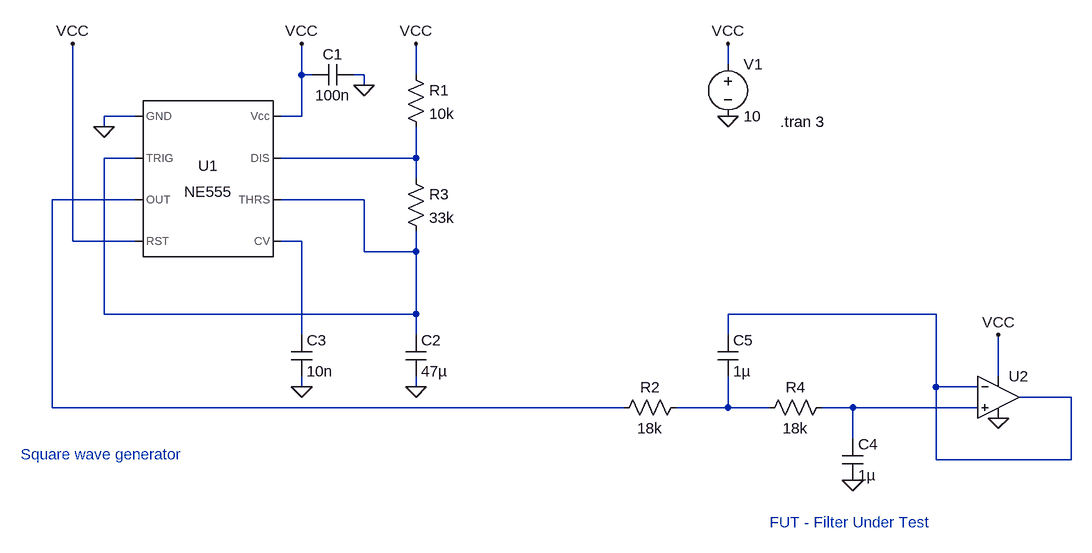
[diagram p0: schematic Step Function Test.asc]
Step Function Test.asc, the LTspice schematic file:
Version 4.1
SHEET 1 1108 680
WIRE 128 -272 128 -304
WIRE -528 -256 -528 -304
WIRE -512 -256 -528 -256
WIRE -432 -256 -448 -256
WIRE -352 -256 -352 -304
WIRE -432 -240 -432 -256
WIRE -784 -192 -832 -192
WIRE -528 -192 -528 -256
WIRE -528 -192 -560 -192
WIRE -832 -176 -832 -192
WIRE -784 -128 -832 -128
WIRE -352 -128 -352 -176
WIRE -352 -128 -560 -128
WIRE -352 -96 -352 -128
WIRE -784 -64 -912 -64
WIRE -432 -64 -560 -64
WIRE -880 0 -880 -304
WIRE -784 0 -880 0
WIRE -528 0 -560 0
WIRE -432 16 -432 -64
WIRE -352 16 -352 -16
WIRE -352 16 -432 16
WIRE -832 112 -832 -128
WIRE -352 112 -352 16
WIRE -352 112 -832 112
WIRE 448 112 128 112
WIRE -528 144 -528 0
WIRE -352 144 -352 112
WIRE 128 144 128 112
WIRE 544 208 544 144
WIRE -528 224 -528 208
WIRE -352 224 -352 208
WIRE 448 224 448 112
WIRE 512 224 448 224
WIRE 656 240 576 240
WIRE -912 256 -912 -64
WIRE -32 256 -912 256
WIRE 128 256 128 208
WIRE 128 256 48 256
WIRE 192 256 128 256
WIRE 320 256 272 256
WIRE 512 256 320 256
WIRE 320 304 320 256
WIRE 448 336 448 224
WIRE 656 336 656 240
WIRE 656 336 448 336
FLAG -832 -176 0
FLAG -432 -240 0
FLAG -528 -304 VCC
FLAG -352 -304 VCC
FLAG -880 -304 VCC
FLAG -352 224 0
FLAG -528 224 0
FLAG 128 -192 0
FLAG 128 -304 VCC
FLAG 544 272 0
FLAG 320 368 0
FLAG 544 144 VCC
SYMBOL Misc\\NE555 -672 -96 R0
SYMATTR InstName U1
SYMBOL cap -448 -272 R90
WINDOW 0 0 32 VBottom 2
WINDOW 3 32 32 VTop 2
SYMATTR InstName C1
SYMATTR Value 100n
SYMBOL res -368 -272 R0
SYMATTR InstName R1
SYMATTR Value 10k
SYMBOL res -368 -112 R0
SYMATTR InstName R3
SYMATTR Value 33k
SYMBOL cap -368 144 R0
SYMATTR InstName C2
SYMATTR Value 47µ
SYMBOL cap -544 144 R0
SYMATTR InstName C3
SYMATTR Value 10n
SYMBOL voltage 128 -288 R0
WINDOW 123 0 0 Left 0
WINDOW 39 0 0 Left 0
SYMATTR InstName V1
SYMATTR Value 10
SYMBOL OpAmps\\UniversalOpAmp 544 240 R0
SYMATTR InstName U2
SYMBOL res 288 240 R90
WINDOW 0 0 56 VBottom 2
WINDOW 3 32 56 VTop 2
SYMATTR InstName R4
SYMATTR Value 18k
SYMBOL cap 304 304 R0
SYMATTR InstName C4
SYMATTR Value 1µ
SYMBOL cap 112 144 R0
SYMATTR InstName C5
SYMATTR Value 1µ
SYMBOL res 64 240 R90
WINDOW 0 0 56 VBottom 2
WINDOW 3 32 56 VTop 2
SYMATTR InstName R2
SYMATTR Value 18k
TEXT 208 -184 Left 2 !.tran 3
TEXT -960 328 Left 2 ;Square wave generator
TEXT 192 432 Left 2 ;FUT - Filter Under Test

The netlist it stands for:
* Step Function Test.asc
X§U1 0 N001 N003 VCC N004 N001 N002 VCC NE555  ; pins GND TRIG OUT RST CV THRS DIS Vcc
C1 0 VCC 100n
R1 VCC N002 10k
R3 N002 N001 33k
C2 N001 0 47µ
C3 N004 0 10n
V1 VCC 0 10
X§U2 N007 N005 VCC 0 N005 level1 Avol=1Meg GBW=10Meg Vos=0 En=0 Enk=0 In=0 Ink=0 Rin=500Meg  ; pins In+ In- V+ V- OUT
R4 N007 N006 18k
C4 N007 0 1µ
C5 N005 N006 1µ
R2 N006 N003 18k
.tran 3
* Square wave generator
* FUT - Filter Under Test
.lib NE555.sub
.lib UniversalOpAmp1.lib
.backanno
.end